# Altium schematic sheet Charge_Discharge.SchDoc
size 100 x 129 mm; SheetNumber: 3; SheetTotal: 3
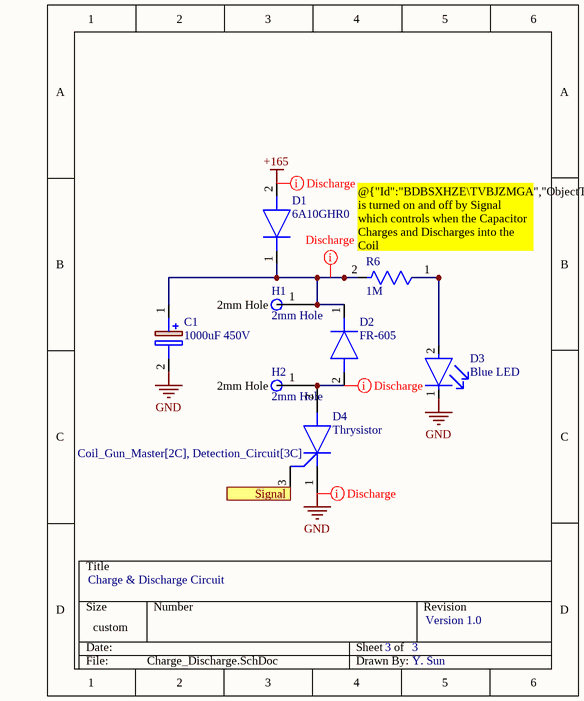
[diagram p0: Charge_Discharge.SchDoc]

## Parts
C1  1000uF 450V  [CAPPRD1000W180D3550H6250]
D1  6A10GHR0  [DIOAD3685W130L885D700]
D2  FR-605  [DIOAD3685W130L885D700]
D3  Blue LED  [FP-XLUR12D-MFG]
D4  Thrysistor  [FP-VS-70TPS12PBF-0]
H1  2mm Hole  [2mmHole]
H2  2mm Hole  [2mmHole]
R6  1M  [FP-CFR16-MFG]

## Ports
Signal (in, see Coil_Gun_Master[2C], Detection_Circuit[3C])

## Nets
+165: D1.2(A)
GND: C1.2(-) D3.1(C) D4.1(K)
Signal: D4.3(G) ; port Signal
NetC1_1: C1.1(+) D1.1(K) D2.1(K) H1.1(2mm_Hole) R6.2
NetD2_2: D2.2(A) D4.2(A) H2.1(2mm_Hole)
NetD3_2: D3.2(A) R6.1

## Layout directives
net class Discharge: +165, GND, NetC1_1, NetD2_2

## Notes on the sheet
- (near R6) @{"Id":"BDBSXHZE\TVBJZMGA","ObjectType":2} is turned on and off by Signal which controls when the Capacitor Charges and Discharges into the Coil
- Charge & Discharge Circuit
- 3
- Version 1.0
- Y. Sun

## Library data of the parts
C1 = EKHS451VSN102MA60S: Capacitor Polarised; Manufacturer_Name: Chemi-Con; Datasheet Link: https://www.mouser.cn/datasheet/2/420/United-Chemi-Con-1708643.pdf; Height: 62.5mm; Manufacturer_Part_Number: EKHS451VSN102MA60S
D1 D2 = 6A10GHR0: Diode; Manufacturer_Name: Taiwan Semiconductor; Datasheet Link: https://www.mouser.ca/ProductDetail/Taiwan-Semiconductor/6A10GHR0/?qs=iDAqbRYIEyDCJDGbzj9j3Q%3D%3D; Manufacturer_Part_Number: 6A10GHR0; Mouser Part Number: 821-6A10GHR0; Mouser Price/Stock: https://www.mouser.co.uk/ProductDetail/Taiwan-Semiconductor/6A10GHR0/?qs=iDAqbRYIEyDCJDGbzj9j3Q%3D%3D
D3 = CMP-02085-08376351-1: 627nm Red LED; 5x8.6mm, Through-Hole Mount with Red Diffused Round Lamp; Test Current: 10mA; Viewing Angle: 30°; Dominant Wavelength: 617nm; Luminous Intensity: 39mcd; Forward Voltage: 1.9V; Wavelength: 627nm; Case/Package: Radial; Lens Color: Red; Mount: Through Hole; Height: 8.6mm; Color: Red; Lifecycle Status: Production; Lens Transparency: Diffused; RoHS: Compliant
D4 = CMP-02544-000003-1: SCR 1.2KV 75A SUPER-247; Hold Current: 200mA; Forward Voltage: 1.4V; Current Rating: 70A; RoHS Compliant: Yes; Min Operating Temperature: -40°C; Mount: Through Hole; Weight: 0.211644oz; Radiation Hardening: No; Series: -; Max Operating Temperature: 125°C; Packaging: Bulk; Package Quantity: 500; Length: 16.1mm; Max Repetitive Reverse Voltage (Vrrm): 1.2kV; Width: 5.5mm; RMS Current (Irms): 75A; Height: 20.8mm; Case/Package: TO-247; Number of Pins: 247; Contact Plating: Tin
H1 H2 = Hole2
R6 = CMP-03212-000007-1: RES 120 OHM 1/4W 5% AXIAL; Resistance: 120R; Power Rating: 250mW; Number of Resistors: 1; Voltage Rating: 200V; Temperature Coefficient: 0ppm/°C; RoHS Compliant: Yes; Mount: Axial; Package Quantity: 5000; Diameter: 1.85mm; Number of Terminations: 2; Packaging: Cut Tape; Max Operating Temperature: 155°C; Resistance Tolerance: 5%; Termination: Axial; Length: 3.5mm; Max Power Dissipation: 250mW; Min Operating Temperature: -55°C; Resistor Type: Thin Film; Technology: CARBON FILM; Case/Package: Axial; Tolerance: 5%; Series: CFR16, Neohm; Voltage Rating (DC): 200V; ELV: Compliant; REACH SVHC: No SVHC